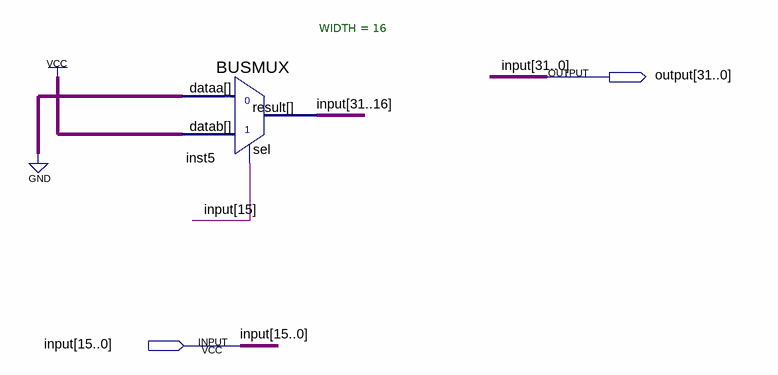
[diagram p0: schematic sheet]
// Quartus schematic sign_extended.bdf as structural Verilog: 1 symbols, 2 pins
module sign_extended (
  input  [15:0] \input ,
  output [31:0] \output 
);

  BUSMUX #(.WIDTH(16)) inst5 (.datab({16{1'b1}}), .sel(\input [15]), .dataa({16{1'b0}}), .result(\output [31:16]));

  assign \output [15:0] = \input ;

  // Other names for the same wires on the sheet: input[31:16] = \output [31:16]
endmodule
